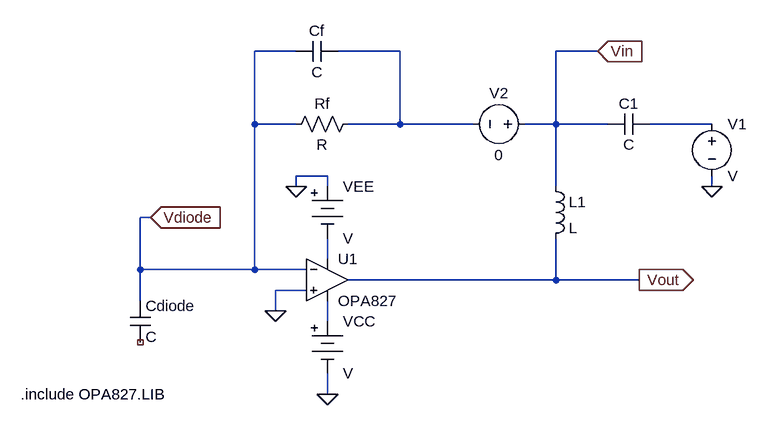
[diagram p0: schematic Sim_openloopgain_noisegain.asc]
Sim_openloopgain_noisegain.asc, the LTspice schematic file:
Version 4
SHEET 1 1004 680
WIRE 304 48 240 48
WIRE 464 48 368 48
WIRE 768 48 704 48
WIRE 240 160 240 48
WIRE 304 160 240 160
WIRE 464 160 464 48
WIRE 464 160 384 160
WIRE 576 160 464 160
WIRE 704 160 704 48
WIRE 704 160 656 160
WIRE 784 160 704 160
WIRE 944 160 848 160
WIRE 352 240 304 240
WIRE 304 256 304 240
WIRE 352 256 352 240
WIRE 704 256 704 160
WIRE 944 256 944 240
WIRE 80 304 64 304
WIRE 352 368 352 336
WIRE 64 384 64 304
WIRE 240 384 240 160
WIRE 240 384 64 384
WIRE 320 384 240 384
WIRE 704 400 704 336
WIRE 704 400 384 400
WIRE 832 400 704 400
WIRE 320 416 272 416
WIRE 64 432 64 384
WIRE 272 448 272 416
WIRE 352 464 352 432
WIRE 352 576 352 544
FLAG 304 256 0
FLAG 352 576 0
FLAG 272 448 0
FLAG 944 256 0
FLAG 832 400 Vout
IOPIN 832 400 Out
FLAG 768 48 Vin
IOPIN 768 48 In
FLAG 80 304 Vdiode
IOPIN 80 304 In
SYMBOL cap 48 432 R0
SYMATTR InstName Cdiode
SYMBOL OpAmps/opamp2 352 336 R0
SYMATTR InstName U1
SYMATTR Value OPA827
SYMBOL Misc/battery 352 448 R0
SYMATTR InstName VCC
SYMBOL Misc/battery 352 240 R0
SYMATTR InstName VEE
SYMBOL Res 400 144 R90
WINDOW 0 0 56 VBottom 2
WINDOW 3 32 56 VTop 2
SYMATTR InstName Rf
SYMBOL Cap 368 32 R90
WINDOW 0 0 32 VBottom 2
WINDOW 3 32 32 VTop 2
SYMATTR InstName Cf
SYMBOL Ind 688 240 R0
SYMATTR InstName L1
SYMBOL Cap 848 144 R90
WINDOW 0 0 32 VBottom 2
WINDOW 3 32 32 VTop 2
SYMATTR InstName C1
SYMBOL Voltage 944 144 R0
SYMATTR InstName V1
SYMBOL Voltage 672 160 R90
WINDOW 0 -32 56 VBottom 2
WINDOW 3 32 56 VTop 2
SYMATTR InstName V2
SYMATTR Value 0
TEXT -120 576 Left 2 !.include OPA827.LIB

The netlist it stands for:
* Sim_openloopgain_noisegain.asc
Cdiode Vdiode NC_01 C
XU1 0 Vdiode N003 N004 Vout OPA827  ; pins In+ In- V+ V- OUT
VCC N004 0 V
VEE 0 N003 V
Rf N001 Vdiode R
Cf N001 Vdiode C
L1 Vin Vout L
C1 N002 Vin C
V1 N002 0 V
V2 Vin N001 0
.include OPA827.LIB
.backanno
.end